# Altium schematic sheet Temp_Sensor.SchDoc
size 300 x 200 mm; SheetNumber: 8; SheetTotal: 11
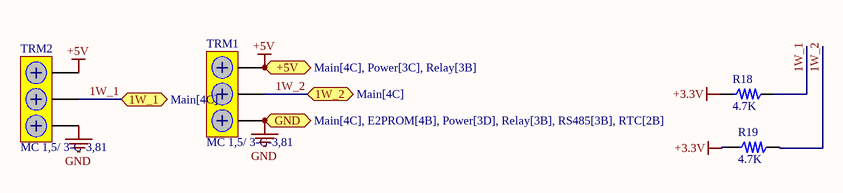
[diagram p0: Temp_Sensor.SchDoc]

## Parts
R18  4.7K  [R0805]
R19  4.7K  [R0805]
TRM1  MC 1,5/ 3-G-3,81  [MC 1,5/ 3-G-3,81]
TRM2  MC 1,5/ 3-G-3,81  [MC 1,5/ 3-G-3,81]

## Ports
1W_1 (bidir, see Main[4C]), 1W_2 (bidir, see Main[4C]), +5V (bidir, see Main[4C], Power[3C], Relay[3B]), GND (bidir, see Main[4C], E2PROM[4B], Power[3D], Relay[3B], RS485[3B], RTC[2B])

## Nets
+3.3V: R18.2 R19.2
+5V: TRM1.1 TRM2.1 ; port +5V
GND: TRM1.3 TRM2.3 ; port GND
1W_1: R18.1 TRM2.2 ; port 1W_1
1W_2: R19.1 TRM1.2 ; port 1W_2

## Library data of the parts
R18 R19 = myRes_1: Value: 4.7K